# EasyEDA Pro project board.epro, board 黄山派核心板_PCB_V1.2
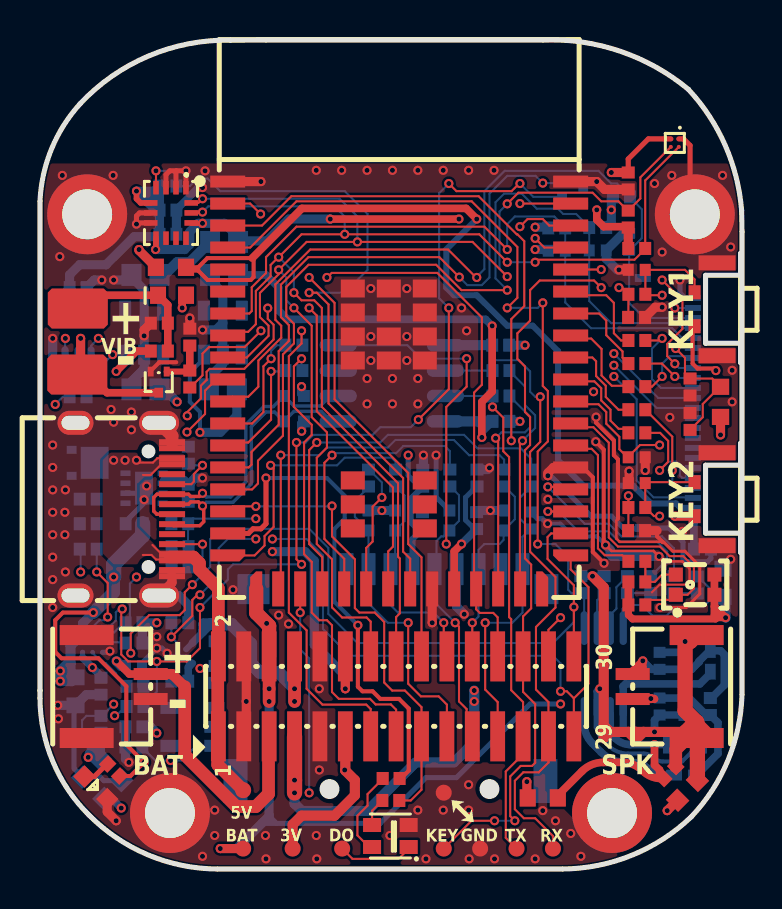
[diagram p11: board, top side]
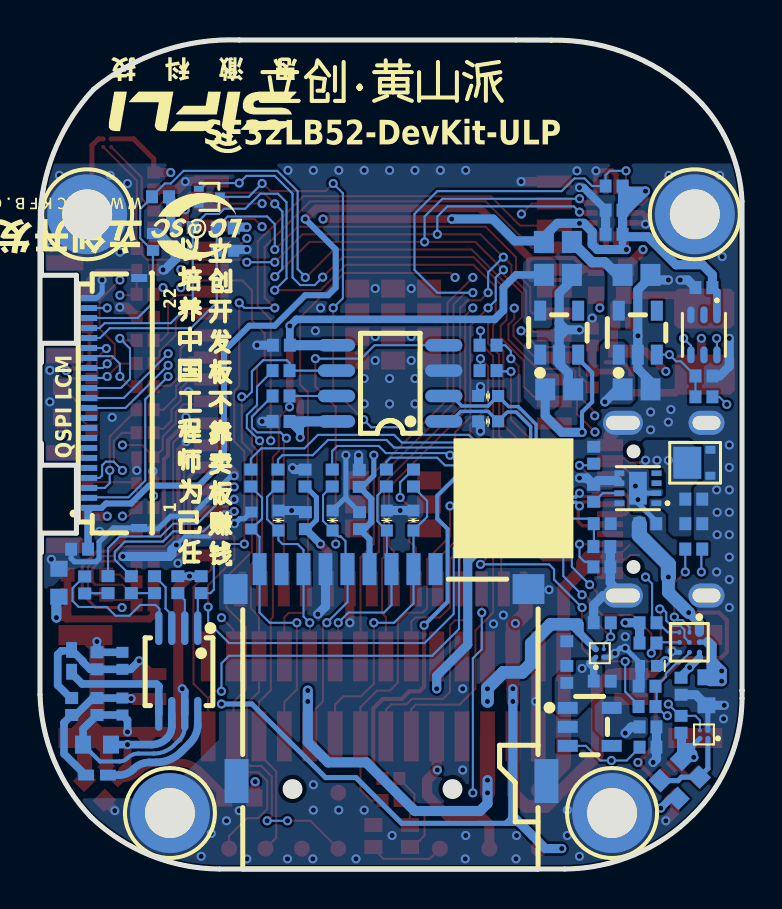
[diagram p12: board, bottom side, seen from below]

Outline 35.11 x 41.47 mm; copper layers: Top Layer, GND2, SIG3, Bottom Layer. Coordinates in mm from the lower left corner of the outline.
Outline path: 0,33.4 0,8.93 arc(0,8.93) 0,8.93 0,8.54 arc(0.64,5.38) 2.45,2.7 arc(5.39,0.71) 8.87,0 26.13,0 arc(29.6,0.69) 32.57,2.61 arc(34.41,5.44) 35.11,8.73 35.11,31.88 35.09,32.94 arc(34.27,36.2) 32.43,39 arc(29.02,40.91) 25.15,41.47 11.3,41.47 9.53,41.46 arc(5.43,40.67) 2.01,38.28 arc(0.58,36.02) 0,33.4
Stack: Top Layer 0.035mm 外层铜厚1oz / Dielectric1 0.2104mm 7628 RC49% 8.6mil / GND2 0.0152mm / Dielectric2 0.6mm 0.6mm H/HOZ 不含铜 / SIG3 0.0152mm / Dielectric3 0.2104mm 7628 RC49% 8.6mil / Bottom Layer 0.035mm 外层铜厚1oz

## Design rules (mm)
net CH_USB_DP: DP1
net CH_USB_DM: DP1
template: 自定义配置
spacing copperThickness1oz (default): track to track 0.102, other pairs 0.102 to 0.203
spacing copperThickness2oz: track to track 0.089, other pairs 0.089 to 0.3
spacing safeClearance1: track to track 0.152, other pairs 0 to 0.3
track width VCC AND GND1: min 0.104, default 0.457, max 2.54
track width TB单端50OHM (default): min 0.102, default 0.104, max 2.54
track width SIG单端50OHM: min 0.142, default 0.142, max 2.54
track width SIG共面单端50OHM: min 0.112, default 0.112, max 2.54
differential pair TB100OHM: width min 0.089, default 0.089, max 0.102; gap min 0.203, default 0.203
differential pair TB90OHM (default): width min 0.17, default 0.17, max 0.17; gap min 0.102, default 0.102
differential pair SIG100OHM: width min 0.089, default 0.102, max 0.102; gap min 0.203, default 0.203
differential pair SIG90OHM: width min 0.104, default 0.137, max 0.137; gap min 0.203, default 0.203
differential pair SIG共面100OHM: width min 0.091, default 0.091, max 0.091; gap min 0.203, default 0.203
differential pair SIG共面90OHM: width min 0.122, default 0.122, max 0.122; gap min 0.203, default 0.203
via viaSize (default): diameter min 0.457, default 0.457, max 0.457; hole min 0.254, default 0.254, max 0.254
net class GND AND VCC uses VCC AND GND1
net GND uses VCC AND GND1
net VCC_3V3 uses VCC AND GND1
net VSYS uses VCC AND GND1
net VBAT uses VCC AND GND1
net VSYS_1 uses VCC AND GND1
net VBUS_5V uses VCC AND GND1
net GS_3V3 uses VCC AND GND1
region e4130 uses safeClearance1
region e4131 uses safeClearance1

## Placement (name value [footprint] x y rotation side)
C1  4.7uF  [0402]  21.84 17.43 270 bottom
C2  1uF  [0402]  2.41 18.5 0 bottom
C3  4.7uF  [0402]  4.71 17.27 0 bottom
C4  1uF  [0402]  8.76 11.82 90 bottom
C5  1uF  [0402]  8.76 9.74 270 bottom
C6  10uF  [C0603]  1.78 8.89 90 bottom
C7  1uF  [0402]  4.75 9.14 180 bottom
C8  4.7uF  [0402]  3.05 9.14 90 bottom
C9  1uF  [0402]  6.99 9.4 0 bottom
C10  1uF  [0402]  4.7 7.11 0 bottom
C11  100nF  [0402]  23.05 22.39 0 bottom
C12  1uF  [0402]  23.04 26.2 180 bottom
C13  1uF  [0402]  33.13 16 0 bottom
C14  100nF  [0402]  32.51 24.11 90 top
C15  4.7uF  [0402]  32.51 22.39 270 top
C16  1uF  [0402]  19.13 17.43 270 bottom
C17  100nF  [0402]  19.14 19.54 270 bottom
C18  22uF  [C0603]  32.26 6.22 0 bottom
C19  100nF  [0402]  31.5 4.83 225 top
C20  100nF  [0402]  31.71 14.22 90 bottom
C21  100nF  [0402]  30.54 14.22 90 bottom
C22  330pF  [0402]  32.26 10.41 270 bottom
C23  330pF  [0402]  33.53 8.13 90 bottom
C24  1uF  [0402]  28.22 14.22 270 bottom
C25  330pF  [0402]  32.26 8.13 270 bottom
C26  4.7uF  [0402]  29.85 14.36 0 top
C27  10nF  [0402]  29.85 13.21 0 top
C28  4.7uF  [0402]  5.97 27.31 0 top
C29  100nF  [0402]  6.4 32.96 180 bottom
C30  100nF  [0402]  6.4 31.75 180 bottom
C31  100nF  [0402]  29.42 34.42 90 top
C33  1uF  [0603]  5.28 23.99 0 bottom
C34  1uF  [0603]  5.28 29.72 0 bottom
C35  100nF  [0402]  1.91 29.08 180 bottom
C36  1uF  [0603]  9.14 23.99 0 bottom
C37  1uF  [0603]  9.21 29.72 0 bottom
C38  1uF  [0402]  21.85 19.56 270 bottom
CARD1  TF-115Y-ACP9  [SIM-SMD_TF-115Y-BCP9]  17.56 9.7 180 bottom
CN1  A1257WR-S-2P  [CONN-SMD_A1257WR-S-2P]  3.94 9.13 270 top
CN2  A1257WR-S-2P  [CONN-SMD_A1257WR-S-2P]  31.24 9.13 90 top
CN3  XDZ127-2-15-S-1.0-G1  [HDR-SMD_30P-P1.27-V-M-R2-C15-LS5.5_1]  17.81 8.64 0 top
D1  ESD5451N  [DFN1006-2L-BI]  30.99 10.41 270 bottom
D2  ESD5451N  [DFN1006-2L-BI]  30.99 8.13 90 bottom
D3  KLXES15AAA1  [D0402-BI]  12.7 22.39 180 bottom
D4  KLXES15AAA1  [D0402-BI]  12.7 23.66 180 bottom
D5  ESD5451N  [DFN1006-2L-BI]  29.85 20.6 180 top
D6  ESD5451N  [DFN1006-2L-BI]  29.46 31.37 270 bottom
D7  ESD5451N  [DFN1006-2L-BI]  27.9 30.94 180 bottom
D8  ESD5451N  [DFN1006-2L-BI]  25.84 30.92 0 bottom
D9  ESD5451N  [DFN1006-2L-BI]  24.55 17.43 270 bottom
D10  KLXES15AAA1  [D0402-BI]  23.19 17.43 270 bottom
D11  KLXES15AAA1  [D0402-BI]  20.48 17.43 270 bottom
D12  KLXES15AAA1  [D0402-BI]  17.77 17.43 270 bottom
D13  KLXES15AAA1  [D0402-BI]  16.43 17.43 270 bottom
D14  ESD5451N  [DFN1006-2L-BI]  29.85 19.31 0 top
D15  ESD5451N  [DFN1006-2L-BI]  29.85 29.97 0 top
D16  CD4148WTP  [D0603-RD]  6.6 28.7 0 top
D17  PTVSHC3N18VU  [DFN-3_L2.0-W2.0-P1.30-BR]  2.16 20.32 180 bottom
D18  PESDHC2FD12VU  [DFN1006-2L-RD]  4.7 10.16 0 bottom
FPC1  AFH34-S22FIA-1H  [FPC-SMD_22P-P0.50_JS_AFH34-S22FIA-1H]  31.4 23.31 90 bottom
L1  PZ1005U121-1R0TF  [L0402]  33.53 10.41 90 bottom
L2  PZ1005U121-1R0TF  [L0402]  32.26 4.7 0 bottom
L3  CBG160808U000T  [L0603]  32.39 3.94 45 top
L4  CBG160808U000T  [L0603]  34.16 14.32 270 bottom
LED1  19-217/GHC-YR1S2/3T  [LED0603-RD]  2.79 4.06 135 top
LED3  WS2812B-2020  [LED-SMD_4P-L2.0-W2.0-TL_WS2812B-2020]  17.52 1.65 180 top
M1  M2-TH  [M2_TH_4_2.5MM]  6.5 2.8 0 top
M2  M2-TH  [M2_TH_4_2.5MM]  28.61 2.8 0 top
M3  M2-TH  [M2_TH_4_2.5MM]  32.75 32.75 0 top
M4  M2-TH  [M2_TH_4_2.5MM]  2.36 32.75 0 top
MT1  -  [TP-3x2MM]  1.89 28.04 0 top
MT2  -  [TP-3x2MM]  1.87 24.73 0 top
Q1  CJ3134K KF  [SOT-723_L1.2-W0.8-P0.40-LS1.2-BR]  26.64 33.62 0 bottom
Q2  CJ3134K KF  [SOT-723_L1.2-W0.8-P0.40-LS1.2-BR]  5.94 24.35 90 top
R1  0Ω  [R0603]  2.67 4.06 135 bottom
R2  510kΩ  [0402]  2.41 17.27 0 bottom
R3  5.1MΩ  [0402]  6.99 12.32 180 bottom
R4  20kΩ  [0402]  7.42 18.8 270 bottom
R5  100kΩ  [0402]  4.75 8.13 180 bottom
R6  4.7kΩ  [0402]  3.68 4.95 315 top
R7  5.1MΩ  [0402]  4.7 6.1 0 bottom
R8  0402WGF5101TCE  [0402]  7.42 20.7 90 bottom
R11  0402WGF1000TCE  [0402]  23.05 23.66 0 bottom
R12  0402WGF1000TCE  [0402]  23.05 24.93 0 bottom
R13  0402WGF5101TCE  [0402]  7.01 15.11 0 bottom
R14  390kΩ  [0402]  6.99 17.27 180 bottom
R15  510kΩ  [0402]  7.01 16.13 0 bottom
R16  22Ω  [0402]  29.85 22.97 0 top
R17  22Ω  [0402]  29.85 21.82 0 top
R18  22Ω  [0402]  29.85 26.44 0 top
R19  22Ω  [0402]  29.85 25.28 0 top
R20  22Ω  [0402]  29.85 24.13 0 top
R21  22Ω  [0402]  16.43 19.56 270 bottom
R22  22Ω  [0402]  17.79 19.56 270 bottom
R23  22Ω  [0402]  20.5 19.56 270 bottom
R24  22Ω  [0402]  23.21 19.56 270 bottom
R25  22Ω  [0402]  24.57 19.56 270 bottom
R26  0Ω  [R0603]  25.15 3.56 0 top
R27  43.2kΩ  [0402]  32.87 14.21 90 bottom
R28  43.2kΩ  [0402]  29.38 14.22 90 bottom
R29  5.1MΩ  [0402]  27.05 14.22 270 bottom
R30  1kΩ  [0402]  29.85 15.39 0 top
R31  0402WGF5101TCE  [0402]  29.85 18.08 0 top
R32  15kΩ  [0402]  29.84 16.93 180 top
R33  0Ω  [0402]  17.55 3.43 180 top
R34  0402WGF5101TCE  [0402]  29.85 28.75 0 top
R35  15kΩ  [0402]  29.84 27.59 180 top
R36  5.1Ω  [0402]  5.97 25.91 0 top
R37  1kΩ  [0402]  7.49 24.51 90 top
R38  1.5MΩ  [0402]  7.49 26.61 270 top
R41  5.1MΩ  [0402]  1.91 24.66 0 bottom
R42  2.2kΩ  [0402]  4.7 11.3 0 bottom
R43  2.2kΩ  [0402]  4.7 12.32 0 bottom
R44  2.2kΩ  [0402]  29.42 32.51 270 top
R45  2.2kΩ  [0402]  29.85 31.04 180 top
R46  2.2kΩ  [0402]  25.84 32.07 180 bottom
R47  2.2kΩ  [0402]  27.9 32.09 0 bottom
R48  2.2kΩ  [0402]  29.08 33.62 180 bottom
R49  0Ω  [R0603]  6.55 30.1 180 top
R50  0Ω  [R0603]  34.04 23.37 270 top
R51  0Ω  [0402]  17.56 4.53 0 top
R52  0Ω  [0603]  9.21 31.37 0 bottom
R54  22Ω  [0402]  1.91 23.62 0 bottom
R55  22Ω  [0402]  12.7 26.2 180 bottom
R56  22Ω  [0402]  12.7 24.93 180 bottom
R57  2.2kΩ  [0402]  6.4 34.16 180 bottom
R58  100kΩ  [0402]  3.05 7.24 270 bottom
R59  0Ω  [R0603]  3.56 4.95 135 bottom
R60  100kΩ  [0402]  2.41 16 0 bottom
SW1  GT-TC191A-H026-L60  [KEY-SMD_GT-TC191A-H026-L60]  33.3 28 90 top
SW2  GT-TC191A-H026-L60  [KEY-SMD_GT-TC191A-H026-L60]  33.3 18.5 90 top
TP1  -  [TP_C080]  10.16 1.02 0 top
TP2  -  [TP_C080]  10.16 3.94 0 top
TP3  -  [TP_C080]  12.64 1.02 0 top
TP4  -  [TP_C080]  23.83 1.02 0 top
TP5  -  [TP_C080]  25.65 1.02 0 top
TP6  -  [TP_C080]  22.01 1.02 0 top
TP7  -  [TP_C080]  20.19 3.82 0 top
TP8  -  [TP_C080]  20.19 1.02 0 top
TP9  -  [TP_C080]  15.11 1.02 0 top
U1  SF32LB52-MOD-1-N16R8  [COMM-SMD_L27.9-W18.0-P1.10_SF32LB52-MOD-1-N16R8]  17.97 24.2 0 top
U2  LP5240HVF  [WLCSP-4_L0.8-W0.8-R2-C2-P0.40-BL]  7.11 10.79 180 bottom
U3  AW32001ECSR  [WLCSP-9_L1.7-W1.7-R3-C3-P0.50-TL]  2.63 11.34 270 bottom
U4  ETA5055V330DS2F  [SOT-23-5_L2.9-W1.6-P0.95-LS2.8-BR]  7.62 7.11 0 bottom
U5  CH340N  [SOP-8_L4.9-W3.9-P1.27-LS6.0-BL]  17.6 24.3 90 bottom
U6  NS4150B  [MSOP-8_L3.0-W3.0-P0.65-LS5.0-BL]  28.19 9.91 0 bottom
U9  LMA2718T421-OA5  [MIC-SMD_4P-L2.8-W1.9-P1.01-TL]  32.77 14.22 90 top
U13  LSM6DS3TR-C  [LGA-14_L3.0-W2.5-P0.50-TL]  6.55 32.82 270 top
U14  MMC5603NJ  [FLIPCHIP-4_L0.8-W0.8-R2-C2-P0.40-TL]  31.75 36.32 270 top
U15  ETA5055V330DS2F  [SOT-23-5_L2.9-W1.6-P0.95-LS2.8-BR]  5.21 26.83 270 bottom
U16  LTR-303ALS-01  [TDFN-6_L2.0-W2.0-P0.65-BL]  1.91 26.72 0 bottom
U17  LP5305AQVF  [DFN-8_L2.0-W2.0-P0.50-BL-EP]  5.21 19.05 90 bottom
U18  ETA5055V330DS2F  [SOT-23-5_L2.9-W1.6-P0.95-LS2.8-BR]  9.14 26.83 270 bottom
U19  LP5240HVF  [WLCSP-4_L0.8-W0.8-R2-C2-P0.40-BL]  1.91 6.73 90 bottom
U20  -  [JLC-QRCODE-6x6]  11.43 18.54 180 bottom
USB1  KH-TYPE-C-16P  [USB-C-SMD_KH-TYPE-C-16P]  4.19 18 270 top

## Footprints (pads in the part's own frame, mm; a bottom-side part is the same pattern mirrored in y, then rotated)
0402
  rect 0.6x0.65 smd: 1(-0.424,0) 2(0.424,0)
0603
  rect 1x1.1 smd: 1(-0.7,0) 2(0.7,0)
C0603
  rect 0.8x0.9 smd: 1(-0.7,0) 2(0.7,0)
COMM-SMD_L27.9-W18.0-P1.10_SF32LB52-MOD-1-N16R8
  rect 1.75x0.6 smd: 1(-8.575,10.188) 2(-8.575,9.088) 3(-8.575,7.987) 4(-8.575,6.888) 5(-8.575,5.787) 6(-8.575,4.688) 7(-8.575,3.587) 8(-8.575,2.487) 9(-8.575,1.387) 10(-8.575,0.287) 11(-8.575,-0.812) 12(-8.575,-1.913) 13(-8.575,-3.013) 14(-8.575,-4.112) 15(-8.575,-5.213) 16(-8.575,-6.312) 17(-8.575,-7.412) 32(8.575,-7.412) 33(8.575,-6.312) 34(8.575,-5.213) 35(8.575,-4.112) 36(8.575,-3.013) 37(8.575,-1.913) 38(8.575,-0.812) 39(8.575,0.287) 40(8.575,1.387) 41(8.575,2.487) 42(8.575,3.587) 43(8.575,4.688) 44(8.575,5.787) 45(8.575,6.888) 46(8.575,7.987) 47(8.575,9.088) 48(8.575,10.188)
  custom 1.75x0.6 smd: 18(-8.575,-8.512) 31(8.575,-8.512)
  rect 0.6x1.75 smd: 19(-6.05,-10.188) 20(-4.95,-10.188) 21(-3.85,-10.188) 22(-2.75,-10.188) 23(-1.65,-10.188) 24(-0.55,-10.188) 25(0.55,-10.188) 26(1.65,-10.188) 27(2.75,-10.188) 28(3.85,-10.188) 29(4.95,-10.188) 30(6.05,-10.188)
  rect 1.2x0.9 smd: 49(-2.32,4.838) 50(-0.52,4.838) 51(1.28,4.838) 52(-2.32,3.638) 53(-0.52,3.638) 54(1.28,3.638) 55(-2.32,2.438) 56(-0.52,2.438) 57(1.28,2.438) 58(-2.32,1.238) 59(-0.52,1.238) 60(1.28,1.238) 63(-2.32,-4.763) 64(-2.32,-5.963) 65(-2.32,-7.162) 66(1.28,-4.763) 67(1.28,-5.963) 68(1.28,-7.162)
  custom 0.6x1.75 smd: 61(-7.15,-10.188) 62(7.15,-10.188)
CONN-SMD_A1257WR-S-2P
  rect 0.6x1.7 smd: 1(0.625,1.6) 2(-0.625,1.6)
  rect 1x2.7 smd: 3(2.575,-1.6) 4(-2.575,-1.6)
D0402-BI
  rect 0.6x0.6 smd: 1(-0.5,0) 2(0.5,0)
D0603-RD
  rect 0.8x0.864 smd: 1(-0.7,0) 2(0.7,0)
DFN1006-2L-BI
  rect 0.55x0.6 smd: 1(-0.425,0) 2(0.425,0)
DFN1006-2L-RD
  rect 0.5x0.6 smd: 1(-0.4,0) 2(0.4,0)
DFN-3_L2.0-W2.0-P1.30-BR
  rect 0.5x0.4 smd: 1(0.575,-0.65) 2(0.575,0.65)
  rect 1.4x1.6 smd: 3(-0.575,0)
DFN-8_L2.0-W2.0-P0.50-BL-EP
  rect 0.28x0.505 smd: 1(-0.75,-0.927) 2(-0.25,-0.927) 3(0.25,-0.927) 4(0.75,-0.927) 5(0.75,0.927) 6(0.25,0.927) 7(-0.25,0.927) 8(-0.75,0.927)
  rect 1.65x0.9 smd: 9(0,0)
FLIPCHIP-4_L0.8-W0.8-R2-C2-P0.40-TL
  round 0.2 smd: A1(-0.2,0.2) A2(0.2,0.2) B1(-0.2,-0.2) B2(0.2,-0.2)
FPC-SMD_22P-P0.50_JS_AFH34-S22FIA-1H
  rect 0.3x0.8 smd: 1(-5.25,1.25) 2(-4.75,1.25) 3(-4.25,1.25) 4(-3.75,1.25) 5(-3.25,1.25) 6(-2.75,1.25) 7(-2.25,1.25) 8(-1.75,1.25) 9(-1.25,1.25) 10(-0.75,1.25) 11(-0.25,1.25) 12(0.25,1.25) 13(0.75,1.25) 14(1.25,1.25) 15(1.75,1.25) 16(2.25,1.25) 17(2.75,1.25) 18(3.25,1.25) 19(3.75,1.25) 20(4.25,1.25) 21(4.75,1.25) 22(5.25,1.25)
  rect 0.4x0.8 smd: 23(6.25,-1.25) 24(-6.25,-1.25)
HDR-SMD_30P-P1.27-V-M-R2-C15-LS5.5_1
  rect 0.74x2.5 smd: 1(-8.89,-2) 2(-8.89,2) 3(-7.62,-2) 4(-7.62,2) 5(-6.35,-2) 6(-6.35,2) 7(-5.08,-2) 8(-5.08,2) 9(-3.81,-2) 10(-3.81,2) 11(-2.54,-2) 12(-2.54,2) 13(-1.27,-2) 14(-1.27,2) 15(0,-2) 16(0,2) 17(1.27,-2) 18(1.27,2) 19(2.54,-2) 20(2.54,2) 21(3.81,-2) 22(3.81,2) 23(5.08,-2) 24(5.08,2) 25(6.35,-2) 26(6.35,2) 27(7.62,-2) 28(7.62,2) 29(8.89,-2) 30(8.89,2)
KEY-SMD_GT-TC191A-H026-L60
  rect 0.7x0.6 smd: 1(-0.85,0.562) 2(0.85,0.562)
  rect 0.75x1.85 smd: 3(-2.325,-0.562) 4(2.325,-0.562)
L0402
  rect 0.79x0.54 smd: 1(-0.545,0) 2(0.545,0)
L0603
  rect 0.8x0.864 smd: 1(-0.7,0) 2(0.7,0)
LED0603-RD
  rect 0.8x0.8 smd: 1(-0.799,-0.004) 2(0.799,0.004)
LED-SMD_4P-L2.0-W2.0-TL_WS2812B-2020
  rect 0.9x0.7 smd: 1(-0.915,0.55) 2(-0.915,-0.55) 3(0.915,-0.55) 4(0.915,0.55)
LGA-14_L3.0-W2.5-P0.50-TL
  rect 0.675x0.28 smd: 1(-1.262,0.75) 2(-1.262,0.25) 3(-1.262,-0.25) 4(-1.262,-0.75) 8(1.262,-0.75) 9(1.262,-0.25) 10(1.262,0.25) 11(1.262,0.75)
  rect 0.28x0.675 smd: 5(-0.5,-1.012) 6(0,-1.012) 7(0.5,-1.012) 12(0.5,1.012) 13(0,1.012) 14(-0.5,1.012)
M2_TH_4_2.5MM
  round 4 hole 2.5: 1(0,0)
MIC-SMD_4P-L2.8-W1.9-P1.01-TL
  rect 0.7x0.7 smd: 1(-0.505,0.965) 2(-0.505,-0.965) 3(0.505,-0.965) 4(0.505,0.965)
MSOP-8_L3.0-W3.0-P0.65-LS5.0-BL
  oval 0.364x1.692 smd: 1(-0.975,-2.146) 2(-0.325,-2.146) 3(0.325,-2.146) 4(0.975,-2.146) 5(0.975,2.146) 6(0.325,2.146) 7(-0.325,2.146) 8(-0.975,2.146)
R0603
  rect 0.806x0.864 smd: 1(-0.753,0) 2(0.753,0)
SIM-SMD_TF-115Y-BCP9
  rect 0.7x1.6 smd: 1(2.225,5.3) 2(1.125,5.3) 3(0.025,5.3) 4(-1.075,5.3) 5(-2.175,5.3) 6(-3.275,5.3) 7(-4.375,5.3) 8(-5.475,5.3) 9(-6.575,5.3)
  rect 1.2x1.5 smd: 10(-7.775,4.3)
  rect 1.6x1.5 smd: 11(6.875,4.3)
  rect 1.2x2.2 smd: 12(-7.725,-5.3) 13(7.775,-5.3)
SOP-8_L4.9-W3.9-P1.27-LS6.0-BL
  oval 0.63x1.865 smd: 1(-1.905,-2.683) 2(-0.635,-2.683) 3(0.635,-2.683) 4(1.905,-2.683) 5(1.905,2.683) 6(0.635,2.683) 7(-0.635,2.683) 8(-1.905,2.683)
SOT-23-5_L2.9-W1.6-P0.95-LS2.8-BR
  rect 1x0.6 smd: 1(1.1,-0.95) 2(1.1,0) 3(1.1,0.95) 4(-1.1,0.95) 5(-1.1,-0.95)
SOT-723_L1.2-W0.8-P0.40-LS1.2-BR
  rect 0.489x0.294 smd: 1(0.529,-0.4) 2(0.529,0.4)
  rect 0.489x0.434 smd: 3(-0.529,0)
TDFN-6_L2.0-W2.0-P0.65-BL
  oval 0.364x0.847 smd: 1(-0.65,-0.999) 2(0,-0.999) 3(0.65,-0.999) 4(0.65,0.999) 5(0,0.999) 6(-0.65,0.999)
TP-3x2MM
  custom 3x2 smd: 1(0,0)
TP_C080
  round 0.8 smd: 1(0,0)
USB-C-SMD_KH-TYPE-C-16P
  oval 1.2x2 hole 0.7x1.7: 1(-4.32,1.765) 2(4.32,1.765)
  oval 1.2x1.8 hole 0.7x1.4: 3(-4.32,-2.415) 4(4.32,-2.415)
  rect 0.3x1.3 smd: A1(-3.35,2.415) A4(-2.55,2.415) A5(-1.25,2.415) A6(-0.25,2.415) A7(0.25,2.415) A8(1.25,2.415) A9(2.55,2.415) A12(3.35,2.415) B1(3.05,2.415) B4(2.25,2.415) B5(1.75,2.415) B6(0.75,2.415) B7(-0.75,2.415) B8(-1.75,2.415) B9(-2.25,2.415) B12(-3.05,2.415)
WLCSP-4_L0.8-W0.8-R2-C2-P0.40-BL
  round 0.2 smd: A1(-0.2,-0.2) A2(-0.2,0.2) B1(0.2,-0.2) B2(0.2,0.2)
WLCSP-9_L1.7-W1.7-R3-C3-P0.50-TL
  round 0.24 smd: A1(-0.5,0.5) A2(0,0.5) A3(0.5,0.5) B2(0,0) B3(0.5,0) C2(0,-0.5) C3(0.5,-0.5)
  oval 0.24x0.19 smd: B1(-0.5,0.001) C1(-0.5,-0.5)

## Nets
As in the schematic.

Pads without a net: CARD1 1 8; FPC1 5 6 7 8 9 10; U1 5 6 62 63 64 65 66 67 68; U4 4; U13 9 10 11; U15 4; U16 2 5; U17 3 4; U18 4; USB1 A8 B8

## Via types
v1: diameter 0.457, hole 0.254, Top Layer to Bottom Layer, 306 vias

## Routing (per net, layer and track width the routed paths; a pad name or vN(x,y) marks a point on that pad's centre or on a via; arc(x,y) is an arc through that point)
GND: length 144.4
  Top Layer w0.104: 30.61,13.84 30.99,14.22 32.34,14.22 32.39,14.27
  Top Layer w0.127: 28.91,17.51 28.83,17.43 28.83,16.53 28.99,16.36 31.14,16.36 ; v1(28.29,16.21) 28.58,15.91 30.69,15.91 v1(30.96,15.64) 31.21,15.39 32.13,15.39 32.49,15.03 32.49,14.37 32.39,14.27
  Top Layer w0.152: 31.16,16.35 31.21,16.35 31.66,15.9 32.25,15.9 33,15.15 33,13.76 32.32,13.08 v1(31.01,13.08)
  Top Layer w0.203: v1(27.81,22.61) 27.81,22.32 28.7,21.43 28.7,20.7 28.91,20.5 28.91,17.51 ; v1(27.8,21.38) 28.19,20.98 28.19,16.3 v1(28.29,16.21) ; 6.82,25.35 5.97,25.35 5.54,24.92 Q2.2 ; 30.86,16.93 30.86,16.64 31.14,16.36 31.16,16.35 ; v1(28.21,15.3) 27.65,15.86 27.65,19.6 27.16,20.09 U1.35
  Top Layer w0.254: U13.6 4.98,32.82 4.83,32.67 v1(4.83,32.26) 4.89,32.32 U13.7 ; U13.3 6.3,34.73 6.49,34.93 6.82,34.93 ; M3.1 32.51,32.99 32.51,36.2 32.19,36.52 U14.A1 ; U13.2 6.8,34.91 6.82,34.93 ; 6.82,34.93 v1(7.3,34.93) U13.1
  Top Layer w0.457: LED1.1 3.36,2.86 v1(3.81,2.41) ; v1(31.12,28.1) 30.77,28.1 R35.1 ; R32.1 30.86,16.93 ; D14.1 29.46,19.35 v1(29.46,19.9) ; C31.1 28.24,33.99 v1(27.84,34.39) U1.48 ; U1.35 25.68,20.09 25.4,19.81 v1(25.4,19.67) ; CN3.3 10.32,6.76 v1(10.32,8.38) 10.32,10.51 CN3.4 ; 31.89,3.44 v1(31.37,2.92) ; D15.1 v1(28.96,29.97) ; USB1.2 6.61,14.33 USB1.A12 ; v1(5.21,26.67) 5.21,26.97 C28.1 ; 30.27,20.6 v1(30.27,19.94) ; R38.1 v1(7.49,27.56) ; 9.39,34.39 v1(11.05,34.39) ; U1.26 v1(19.62,12.32)
  Top Layer w0.635: USB1.A1 6.61,21.67 5.96,22.32
  Bottom Layer w0.203: v1(28.29,16.21) 27.86,16.64 26.67,16.64 26.03,17.28 v1(25.39,17.28)
  Bottom Layer w0.254: 19.81,18.6 v1(19.81,20.7) ; 19.81,18.6 D11.1 ; 19.81,18.6 19.81,18.53 C16.1 ; U17.2 4.96,18.8 U17.9 v1(5.21,18.48) 5.21,18.31 4.29,17.39 C3.1 ; 5.1,10.31 v1(5.84,11.05) 6.1,11.05 v1(6.36,10.79) 6.55,10.59 U2.B1 ; D9.1 24.88,17.53 25.12,17.53 25.36,17.28 v1(25.39,17.28) ; v1(3.5,10.9) 3.44,10.84 U3.C3 ; C6.1 1.71,8.12 U19.B1 ; v1(25.4,19.67) 25.54,19.67 27.56,17.65 28.58,17.65 29.21,17.02 30.1,17.02 FPC1.24 31.45,17.06 32.16,16.36 32.16,15.52 32.31,15.37 33.38,15.37 33.55,15.54 C13.2 ; v1(32,29.46) 32,28.83 32.27,28.56 FPC1.22
  Bottom Layer w0.381: v1(8.13,34.09) 7.93,34.09 6.82,32.99
  Bottom Layer w0.457: CARD1.6 20.83,13.13 v1(21.22,12.75) ; 6.22,19.43 7.21,19.43 R4.1 7.75,19.56 v1(8.13,19.56) ; C11.2 v1(24,22.39) ; R3.1 7.42,13.21 6.95,13.68 USB1.2 6.58,14.31 R13.1 R15.1 ; v1(3.09,29.46) 2.71,29.46 C35.1 ; 9.14,26.63 9.14,26.97 ; 9.14,26.63 8.8,26.97 ; 9.14,26.63 U18.2 9.14,25.27 8.69,24.82 8.69,24.24 C36.1 ; 9.14,26.97 8.8,26.97 ; 9.14,26.97 9.14,27.31 ; 8.8,26.97 v1(8.13,26.97) ; 8.8,26.97 9.14,27.31 ; v1(13.09,21.9) 13.09,22.28 D3.1 ; v1(0.64,26.54) 0.64,25.15 1.12,24.66 R41.1 ; D8.1 25.36,30.99 v1(24.77,30.99) ; v1(3.68,29.46) 4.32,29.46 C34.1 4.58,29.6 5.21,28.96 5.21,25.02 4.58,24.39 C33.1 ; C10.1 R7.1 4.28,5.5 v1(4.45,5.33) ; C30.1 C29.1 ; D10.1 v1(22.52,17.93) 21.92,17.93 C1.1 ; v1(28.29,16.21) 28.51,15.98 28.51,15.75 28.63,15.64 v1(30.96,15.64) ; D6.1 29.17,31.79 D7.1 28.32,30.52 28.87,29.97 v1(28.96,29.97) ; 9.14,27.31 9.14,28.81 8.51,29.45 C37.1 ; C38.1 22.4,19.98 v1(22.48,20.07) ; C12.1 v1(24.26,26.2) ; v1(19.18,20.7) 19.18,20 C17.1 ; v1(0.89,8.19) C6.1 2.31,8.72 C8.1 ; D18.2 5.1,9.17 5.12,9.14 ; D12.1 D13.1 ; D4.1 13.08,23.78 v1(13.08,24.13)
  vias: v1(0.64,21.21) v1(0.64,20.09) v1(0.64,18.97) v1(0.64,17.84) v1(0.64,16.72) v1(0.64,15.6) v1(0.64,14.48) v1(0.64,13.08) v1(0.92,7.51) v1(0.99,30.63) v1(1.12,34.7) v1(1.27,18.97) v1(1.24,17.84) v1(1.24,16.72) v1(1.27,14.86) v1(3.56,22.99) v1(3.66,34.7) v1(3.68,22.35) v1(4.57,22.86) v1(4.57,21.97) v1(5.33,19.16) v1(5.84,11.62) v1(8.13,0.64) v1(8.26,34.93) v1(8.74,2.95) v1(8.74,1.68) v1(9.65,13.97) v1(11.28,1.68) v1(11.3,0.51) v1(11.94,12.7) v1(12.43,12.26) v1(13.82,34.95) v1(13.82,1.68) v1(13.84,0.51) v1(13.97,9.02) v1(13.97,4.95) v1(15.09,34.95) v1(16.36,34.95) v1(16.36,24.54) v1(16.36,23.27) v1(16.55,29.04) v1(16.55,26.64) v1(16.55,25.44) v1(17.1,17.93) v1(17.5,1.68) v1(17.63,34.95) v1(17.63,24.54) v1(17.63,23.27) v1(18.35,29.04) v1(18.35,26.64) v1(18.35,25.44) v1(18.9,34.95) v1(18.9,24.54) v1(18.9,23.27) v1(18.9,2.95) v1(19.3,0.51) v1(20.17,34.95) v1(20.17,2.95) v1(21.08,28.07) v1(21.34,26.92) v1(21.44,34.95) v1(21.44,4.22) v1(21.44,2.95) v1(21.46,0.51) v1(22.71,34.95) v1(22.73,0.51) v1(24.77,0.51) v1(25.15,2.92) v1(25.4,18.49) v1(25.78,2.41) v1(26.54,1.78) v1(27.05,0.64) v1(27.69,23.88) v1(30.73,34.29) v1(31.12,30.86) v1(31.5,22.59) v1(31.6,34.7) v1(32.13,16.89) v1(34.14,34.7) v1(34.54,31.12) v1(34.62,24.95) v1(34.62,23.37) v1(34.54,15.49)
VBAT: length 81.5
  Top Layer w0.203: v1(33.8,24.93) 33.7,25.04 32.89,25.04 32.64,25.28 32.64,27.05 SW1.1
  Top Layer w0.457: TP1.1 v1(9.02,1.02) ; SW2.1 v1(31.75,17.65)
  Top Layer w0.635: v1(11.46,8.38) v1(11.46,9.02) CN3.6
  Top Layer w0.711: CN3.6 11.46,12.16 v1(11.34,12.29) 10.82,12.81 U1.61
  SIG3 w0.254: v1(33.8,24.93) 33.8,22.95 34.54,22.21 34.54,21.34 34.16,20.96 33.15,20.96 32.51,20.32 32.51,18.41 v1(31.75,17.65) 31.24,18.16 29.16,18.16 26.87,20.45 24.64,20.45 23.88,19.69 23.88,16.19 25.27,14.79 25.27,8.89 25.91,8.26 v1(26.04,8.26)
  SIG3 w0.457: v1(2.62,10.08) 3.23,9.47 8.2,9.47 8.2,9.47 8.23,9.47 11.05,12.29 v1(11.34,12.29)
  Bottom Layer w0.254: U3.A3 2.13,10.57 ; 11.82,2.29 11.15,2.29 11.13,2.31 ; 11.82,2.29 11.46,2.65 ; 11.82,2.29 17.02,2.29 19.3,4.57 20.83,4.57 24.51,8.26 v1(26.04,8.26)
  Bottom Layer w0.381: C8.2 3.05,9.65 v1(2.62,10.08) 2.13,10.57
  Bottom Layer w0.457: v1(9.02,1.02) 9.83,1.02 11.46,2.65 v1(11.46,8.38) v1(11.46,9.02)
VBAT_S: length 16.3
  Top Layer w0.381: v1(3.83,10.4) 4.47,9.75 5.66,9.75
  Top Layer w0.508: 7.24,9.12 6.6,9.75 5.66,9.75
  Top Layer w0.635: 7.24,9.12 7.24,5.71 9.82,3.13 10.8,3.13 11.43,3.76 11.43,6.64
  Bottom Layer w0.508: v1(3.83,10.4) 4.06,10.16 D18.1
VBUS_5V: length 37.8
  Top Layer w0.203: v1(2.67,12.83) 1.14,12.83 0.76,12.45 0.76,10.86 1.08,10.54 2.92,10.54 4.32,9.14 4.32,6.22 v1(5.21,5.33) 4.53,4.65 R6.2
  SIG3 w0.457: v1(8,21.84) 8,21.08 6.6,19.69 6.6,17.53 5.84,16.76 4.83,16.76 3.68,15.62 v1(3.68,14.61)
  Bottom Layer w0.203: v1(8,21.84) 8,22.86 7.49,23.37 7.49,24.83 8.19,25.53 U18.3
  Bottom Layer w0.457: 9.84,23.99 9.84,22.67 9.02,21.84 v1(8,21.84) ; v1(2.67,12.83) 2.13,12.29 U3.A1
  Bottom Layer w0.635: v1(3.68,14.61) 3.68,13.84 v1(2.67,12.83)
  Bottom Layer w0.762: C3.2 5.13,16.69 3.68,15.24 v1(3.68,14.61)
VCC_3V3: length 100.9
  Top Layer w0.457: CN3.12 v1(15.27,9.02) ; R50.2 v1(34.04,21.72)
  SIG3 w0.457: v1(15.27,9.02) 16.79,7.49 21.84,7.49 24.64,10.29 24.64,14.66 21.08,18.22 21.08,21.18 ; 23.37,24 23.5,24 23.76,24.27 ; 23.37,24 22.23,24 21.08,22.86 21.08,22 ; 23.37,24 23.76,23.61 ; 23.76,24.27 23.76,23.62 23.76,23.61 ; 23.76,24.27 25.78,26.29 25.78,31.37 25.04,32.11 v1(24.77,32.11) ; v1(5.84,12.32) 9.02,12.32 11.62,14.93 v1(11.62,15.88) ; 20.67,21.59 18.92,21.59 18.42,21.08 v1(18.42,20.7) ; 20.67,21.59 21.08,21.18 ; 20.67,21.59 21.08,22 ; 20.67,21.59 21.08,21.59 21.08,21.58 ; 23.76,23.61 25.4,21.97 28.07,21.97 29.46,20.57 31.62,20.57 32.77,21.72 32.77,22.14 ; v1(34.04,21.72) 33.2,21.72 ; 33.2,21.72 32.77,22.14 ; 33.2,21.72 32.77,21.72 ; 32.77,22.14 32.77,29.59 32.13,30.23 29.97,30.23 28.57,31.62 v1(28.57,32.97) ; 21.08,21.58 21.08,22 ; 21.08,21.58 21.08,21.18
  Bottom Layer w0.254: v1(18.42,20.7) 18.42,19.69 18.98,19.12 C17.2
  Bottom Layer w0.305: CARD1.4 18.63,16.5 C16.2 18.89,17 18.54,17.35 18.54,18.52 C17.2
  Bottom Layer w0.457: v1(11.62,15.88) 13.26,15.88 13.72,15.42 13.72,11.22 15.27,9.66 v1(15.27,9.02) ; R48.2 28.57,33.54 v1(28.57,32.97) 28.57,32.34 R47.2 ; v1(5.84,12.32) R43.2 R42.2 ; R46.2 25.38,32.11 v1(24.77,32.11)
VCC_3V3_S: length 19.6
  Top Layer w0.508: TP3.1 12.64,2.22 13.08,2.67 14.73,2.67 15.75,3.68 15.75,4.45 15.27,4.92 CN3.11
  SIG3 w0.457: v1(15.24,4.95) 15.24,5.84 14.28,6.8 v1(5.84,6.8)
  Bottom Layer w0.457: v1(5.84,6.8) 5.53,7.11 C10.2
VDD33_VOUT: length 39.3
  Top Layer w0.203: v1(15.9,12.19) 15.9,9.12 16.13,8.89 16.64,8.89 17.02,8.51 17.96,8.51 18.44,8.02 18.44,4.92 18.05,4.53
  Top Layer w0.254: v1(11.3,19.56) 11.3,17.27 11.05,17.02 10.66,17.02 10.43,16.79 9.39,16.79
  Top Layer w0.381: v1(3.81,24.89) 4.83,25.91 R36.1
  SIG3 w0.381: v1(3.81,24.89) 4.57,24.13 9.78,24.13 10.74,23.17 10.74,20.12 v1(11.3,19.56)
  Bottom Layer w0.203: v1(11.3,19.56) 14.35,19.56 15.24,18.67 15.24,17.53 14.73,17.01 14.73,13.37 v1(15.9,12.19)
ADCIN: length 15.7
  Top Layer w0.104: 30.28,13.46 31.54,13.46 U9.1 32.39,13.72 32.7,14.04 32.7,15.12 32.17,15.65 31.49,15.65 31.01,16.13 28.91,16.13 28.45,16.59 28.45,21.33 27.68,22.1 26.73,22.1 U1.37
CH_3V3: length 27
  Top Layer w0.381: v1(22.1,21.59) 22.1,23.37 22.62,23.89 v1(22.62,27.17)
  Bottom Layer w0.381: 21.86,22.39 22.1,22.15 22.1,21.86 ; C12.2 v1(22.62,27.17) 22.29,27.5 12.38,27.5 11.94,27.94 11.94,29.08 11.3,29.72 C37.2 ; v1(22.1,21.59) 22.1,21.86 ; 22.1,21.86 C11.1
  Bottom Layer w0.508: 20.53,22.39 C11.1 ; 20.53,26.2 C12.2
CH_RTS#: length 40.4
  Top Layer w0.104: v1(20.32,16.26) 20.32,23.11 21.34,24.13 v1(21.34,25.53)
  SIG3 w0.104: v1(3.68,8.25) 3.83,8.39 8.9,8.39 10.92,10.41 17.27,10.41 19.05,12.19 19.05,14.99 v1(20.32,16.26)
  Bottom Layer w0.104: v1(3.68,8.25) 3.1,7.66 R58.1 2.33,7.66 2.11,7.44 U19.B2 ; U5.4 18.38,26.2 19.05,25.53 v1(21.34,25.53)
CH_USB_DM: length 15.6
  Top Layer w0.17: v1(8.13,18.8) 7.97,18.64 7.54,18.64 7.43,18.75 USB1.B7 5.85,18.75 5.69,18.58 5.69,17.9 5.84,17.75 USB1.A7
  Bottom Layer w0.17: 15.16,23.66 14.52,23.66 14.02,23.16 12.7,23.16 D4.2 11.67,23.13 11.19,23.13 10.3,22.24 10.3,19.37 9.54,18.61 8.31,18.61 v1(8.13,18.8)
CH_USB_DP: length 15.4
  Top Layer w0.17: USB1.B6 6.68,17.17 7.99,17.17 8.19,17.37 8.19,18.1 v1(8.13,18.16) 7.93,18.36 7.54,18.36 7.43,18.25 USB1.A6
  Bottom Layer w0.17: v1(8.13,18.16) 8.31,18.34 9.65,18.34 10.57,19.26 10.57,22.13 11.3,22.86 11.73,22.86 D3.2 12.7,22.89 14.07,22.89 14.57,22.39 15.16,22.39
CHG_INT: length 52
  Top Layer w0.104: v1(4.11,13.01) 4.06,12.96 4.06,10.73 4.41,10.38 v1(5.84,10.38) 7.34,10.38 8,11.05 v1(8,13.08) ; v1(12.83,21.34) 12.83,15.49 v1(13.08,15.24) ; v1(20.45,28.07) 20.45,24 v1(18.92,22.48) ; v1(20.45,34.29) 20.83,33.91 23.59,33.91 23.97,34.29 v1(24,34.29)
  Bottom Layer w0.104: v1(20.45,28.07) 19.96,28.55 19.96,33.8 v1(20.45,34.29) ; v1(12.83,21.34) 13.29,21.34 13.67,21.72 16.64,21.72 17.02,22.1 18.54,22.1 v1(18.92,22.48) ; Q1.3 24.67,33.62 v1(24,34.29) ; U3.B2 2.88,11.59 2.88,11.97 3.07,12.16 3.53,12.16 3.79,12.43 3.79,12.83 3.97,13.01 v1(4.11,13.01) ; v1(13.08,15.24) 9.65,15.24 9.4,14.99 9.4,14.48 v1(8,13.08) ; 5.12,8.13 5.12,8.15 5.84,8.87 v1(5.84,10.38)
DAC1N: length 10.2
  Top Layer w0.104: U1.34 26.41,19.11 v1(25.4,19.11)
  Bottom Layer w0.104: v1(25.4,19.11) 27.24,17.27 28.45,17.27 29.08,16.64 31.12,16.64 31.71,16.04 C20.2
DAC1P: length 9.5
  Top Layer w0.104: U1.33 v1(25.4,17.89)
  Bottom Layer w0.104: v1(25.4,17.89) 25.93,17.89 26.92,16.89 28.45,16.89 28.96,16.38 30.86,16.38 31.37,15.88 31.37,15.47 C21.2
GS_3V3: length 52.3
  Top Layer w0.254: 31.55,36.52 30.43,36.52 29.42,35.52 C31.2 ; 7.57,32.3 v1(8.13,32.3)
  Top Layer w0.28: v1(4.83,33.91) 4.83,33.53 5.04,33.32 U13.5 ; U13.8 5.8,31.01 v1(5.78,30.99)
  Top Layer w0.381: v1(27.85,32.97) 27.85,32.48 28.19,32.13 29.38,32.13 R44.2 ; v1(14.52,32.51) v1(20.96,32.51)
  Top Layer w0.457: R44.2 R45.2 ; C31.2 v1(28.58,34.84)
  SIG3 w0.457: 27.85,33.37 27.54,33.67 ; 27.85,33.37 28.16,33.67 ; 27.85,33.37 v1(27.85,32.97) ; 27.54,33.67 28.16,33.67 ; 27.54,33.67 26.29,34.93 23.75,34.93 22.86,34.04 22.48,34.04 v1(20.96,32.51) ; 28.16,33.67 28.58,34.09 v1(28.58,34.84)
  Bottom Layer w0.381: C35.2 1.26,28.86 U16.1 ; C30.2 5.98,31.05 5.91,30.99
  Bottom Layer w0.457: C29.2 5.98,33.54 ; C29.2 C30.2 5.86,31.63 4.71,31.63 3.3,30.23 1.98,30.23 1.48,29.72 C35.2 ; C29.2 5.78,32.96 5.19,33.54 ; 5.98,33.54 5.19,33.54 ; 5.98,33.54 R57.2 5.72,33.91 v1(4.83,33.91) 5.19,33.54 ; 9.91,31.42 9.91,31.62 9.23,32.3 v1(8.13,32.3) 7.92,32.3 7.49,31.88 7.49,31.24 7.24,30.99 v1(5.78,30.99) ; 9.91,31.42 11.35,31.42 12.45,32.51 v1(14.52,32.51) ; 9.91,31.42 R52.2
MIC_BIAS: length 8
  Top Layer w0.104: R30.1 29.13,15.69 28.25,15.69 27.9,16.04 27.9,20.7 27.59,21.02 26.71,21.02 U1.36
MIC_GND: length 10.6
  Top Layer w0.355: v1(34.29,12.57) 33.85,12.57 33.78,12.51 29.63,12.51 29.43,12.71 C27.1
  Top Layer w0.381: 33.73,13.13 v1(34.29,12.57) ; 33.73,13.13 U9.2 U9.3 ; 33.73,13.13 33.73,12.69 33.85,12.57 ; C26.1 C27.1
  Bottom Layer w0.508: 34.16,13.52 34.29,13.4 v1(34.29,12.57)
PA_00_LCD_QSPI_RSTB: length 18
  Top Layer w0.104: U1.47 v1(24,33.29)
  SIG3 w0.104: v1(28.7,25.78) 27.18,27.31 27.18,32.13 26.02,33.29 v1(24,33.29)
  Bottom Layer w0.104: v1(28.7,25.78) 30.92,23.56 FPC1.12
PA_01_LCD_BL_PWM: length 22.5
  Top Layer w0.104: U1.46 25.47,32.19 25.15,32.51 24.38,32.51 v1(24,32.13)
  SIG3 w0.104: v1(28.7,24.64) 26.29,27.05 26.29,31.75 25.53,32.51 24.38,32.51 v1(24,32.13)
  Bottom Layer w0.104: FPC1.2 32.62,18.59 30.68,18.59 29.85,19.43 29.85,23.5 v1(28.7,24.64)
PA_02_LCD_QSPI_TE: length 20
  Top Layer w0.104: v1(24.77,31.55) 25.22,31.09 U1.45
  SIG3 w0.104: v1(28.7,25.2) 26.8,27.1 26.8,31.88 25.78,32.89 24,32.89 23.62,32.51 23.62,31.75 23.83,31.55 v1(24.77,31.55)
  Bottom Layer w0.104: v1(28.7,25.2) 30.84,23.06 FPC1.11
PA_03_LCD_QSPI_CS: length 10.9
  Top Layer w0.104: U1.44 v1(28.07,29.99) ; v1(31.12,29.46) 32.13,28.45 32.13,27.02 31.37,26.26 31.37,25.65 v1(31.75,25.27)
  SIG3 w0.104: v1(31.12,29.46) 28.59,29.46 v1(28.07,29.99)
  Bottom Layer w0.104: v1(31.75,25.27) 31.96,25.06 FPC1.15
PA_04_LCD_QSPI_CLK: length 4.8
  Top Layer w0.104: R18.1 29.06,26.44 28.7,26.8 28.7,28.32 28.32,28.7 26.73,28.7 U1.43
PA_05_LCD_QSPI_D0: length 4.5
  Top Layer w0.104: U1.42 27.97,27.79 28.32,27.43 28.32,26.7 29.14,25.89 29.14,25.58 R19.1
PA_06_LCD_QSPI_D1: length 4.7
  Top Layer w0.104: R20.1 29.38,24.17 28.6,24.17 28.09,24.69 28.09,26.02 27.57,26.53 26.69,26.53 U1.41
PA_07_LCD_QSPI_D2: length 4.7
  Top Layer w0.104: R16.1 28.94,22.97 28.3,23.61 28.3,24.18 27.81,24.66 27.81,25.4 27.63,25.59 U1.40
PA_08_LCD_QSPI_D3: length 4.7
  Top Layer w0.104: R17.1 29.23,22.02 28.94,22.02 28.53,22.43 28.53,22.98 28.07,23.44 28.07,24.05 27.73,24.4 26.63,24.4 U1.39
PA_09_TP_RSTN: length 15.2
  Top Layer w0.104: v1(30.99,21.21) 30.01,21.21 29.42,20.62 D5.2 29.38,20.6 28.98,21 28.98,21.62 28.32,22.27 28.32,22.86 27.93,23.25 26.68,23.25 U1.38
  SIG3 w0.104: v1(31.75,28.06) 32.39,27.43 32.39,22.61 v1(30.99,21.21)
  Bottom Layer w0.104: FPC1.21 v1(31.75,28.06)
PA_10_I2C0_SCL: length 41.7
  Top Layer w0.104: CN3.30 v1(26.7,13.11) 26.7,14.19 25.39,15.51 25.39,16.61 25.57,16.79 U1.32 ; v1(7.62,14.22) 7.24,13.84 7.24,12.95 6.99,12.7 5.46,12.7 4.54,11.78 v1(4.54,10.8)
  Bottom Layer w0.104: v1(7.62,14.22) 8.51,15.11 8.51,16.51 9.02,17.02 13.46,17.02 14.42,16.06 14.42,12.76 15.88,11.3 25.65,11.3 26.7,12.35 v1(26.7,13.11) ; v1(4.54,10.8) 4.54,11.04 R42.1 4.24,11.34 U3.C2
PA_11_I2C0_SDA: length 44.3
  Top Layer w0.104: 26.7,8.54 26.35,8.89 v1(26.04,8.89) ; 26.7,8.54 CN3.29 ; 26.7,8.54 27.43,9.27 27.43,14.1 26.54,14.99 U1.31
  SIG3 w0.104: v1(11.62,16.51) 11.12,16 10.16,16 9.4,16.76 6.86,16.76 6.35,16.26 5.08,16.26 4.45,15.62 4.45,14.99 v1(4.83,14.61)
  Bottom Layer w0.104: v1(11.62,16.51) 13.34,16.51 14.15,15.69 14.15,12.01 15.49,10.67 25.65,10.67 26.04,10.29 v1(26.04,8.89) ; v1(4.83,14.61) 4.5,14.28 4.5,12.54 R43.1 4.19,12.32 3.71,11.84 U3.C1
PA_18_UART_RXD: length 11.8
  Top Layer w0.104: U1.30 24,14.02 24,21.3 v1(24.13,21.42)
  Bottom Layer w0.104: R12.2 23.48,24.91 24.26,24.13 24.26,23.21 24.77,22.7 24.77,22.06 v1(24.13,21.42)
PA_19_UART_TXD: length 11.5
  Top Layer w0.104: v1(22.79,21.55) 22.92,21.42 U1.29
  Bottom Layer w0.104: v1(22.79,21.55) 23.08,21.84 24.26,21.84 24.51,22.1 24.51,22.63 R11.2
PA_20_VIB_PWM: length 37.6
  Top Layer w0.104: v1(11.05,26.92) 10.23,26.11 8.46,26.11 8.13,25.78 8.13,24.7 7.52,24.09 R37.1 ; CN3.24 22.89,12.59 22.67,12.81 22,12.81 21.82,12.99 U1.28 21.71,14.12 21.71,23.83 22.1,24.22 22.1,27.59 19.87,29.82 14.59,29.82 14.36,29.59 v1(14.35,29.59)
  SIG3 w0.104: v1(11.05,26.92) 11.94,27.81 11.94,28.96 13.08,30.1 13.84,30.1 v1(14.35,29.59)
PA_24_SPI1_DO: length 13.2
  Top Layer w0.104: 9.39,15.69 10.73,15.69 11.23,16.18 11.23,16.66 11.68,17.11 11.68,20.04 11.53,20.19
  Bottom Layer w0.104: R22.1 17.79,20.37 17.58,20.57 15.24,20.57 14.86,20.19 v1(11.53,20.19)
PA_24_SPI1_DO_1: length 11.1
  Top Layer w0.104: v1(20.19,12.32) 20.19,10.99 20.42,10.77
  Bottom Layer w0.104: v1(20.19,12.32) 19.69,12.83 17.91,12.83 17.53,13.2 CARD1.3 17.77,15.24 D12.2 18.24,17.4 18.24,18.68 17.79,19.13
PA_25_SPI1_DI: length 19.1
  Top Layer w0.104: v1(12.04,20.7) 12.04,14.14 U1.19
  Bottom Layer w0.104: v1(12.04,20.7) 13.97,20.7 14.35,21.08 17.4,21.08 17.78,21.46 20.7,21.46 21.46,20.7 22.99,20.7 23.21,20.48 R24.1
PA_25_SPI1_DI_1: length 10.1
  Top Layer w0.104: CN3.22 v1(21.62,12.32)
  Bottom Layer w0.104: 23.21,19.13 23.24,19.13 23.75,18.62 23.75,17.5 D10.2 23.19,16.46 22.98,16.26 22.23,16.26 21.93,15.96 CARD1.7 21.93,12.63 v1(21.62,12.32)
PA_26: length 23
  Top Layer w0.104: U1.20 v1(13.02,12.83)
  SIG3 w0.104: 13.46,3.84 13.46,5.09 13.11,5.43 v1(6.53,5.43)
  Bottom Layer w0.104: 5.03,6.18 5.03,6.16 5.77,5.43 v1(6.53,5.43) 7.08,5.43 7.81,6.16 U4.3 ; v1(13.02,12.83) 13.02,10.99 13.46,10.54 v1(13.46,3.81)
PA_27_SD_DET: length 19.7
  Top Layer w0.104: v1(13.84,21.34) 13.46,20.96 13.46,16.26 14.12,15.6 U1.21
  Bottom Layer w0.104: v1(13.84,21.34) 17.02,21.34 17.4,21.72 21.21,21.72 21.88,21.04 24.04,21.04 24.57,20.52 R25.1
PA_27_SD_DET_1: length 15
  Top Layer w0.104: v1(22.27,12.32) 22.27,8.98 22.89,8.35 CN3.23
  Bottom Layer w0.104: 24.52,17.01 D9.2 ; 24.52,17.01 24,17.53 24,18.57 24.57,19.13 ; 24.52,17.01 24.13,16.62 CARD1.9 24.13,12.83 23.62,12.32 v1(22.27,12.32)
PA_28_SPI1_CLK: length 14.4
  Top Layer w0.104: U1.22 15.22,15.52 14.22,16.51 14.22,20.32 v1(14.61,20.7)
  Bottom Layer w0.104: R23.1 20.5,20.9 20.24,21.16 18.17,21.16 17.81,20.81 14.71,20.81 v1(14.61,20.7)
PA_28_SPI1_CLK_1: length 14
  Top Layer w0.104: CN3.21 21.34,6.92 21.34,8 20.96,8.38 20.96,12.13 v1(20.77,12.32)
  Bottom Layer w0.104: v1(20.77,12.32) 19.73,13.35 CARD1.5 ; 19.83,15.07 19.83,16.41 20.07,16.64 20.18,16.64 D11.2 20.96,17.41 20.96,18.7 20.52,19.13 20.5,19.13
PA_29_SPI1_CS: length 6.6
  Top Layer w0.104: v1(17.1,18.59) 16.64,18.12 16.64,16.38 16.32,16.06 U1.23
  Bottom Layer w0.104: v1(17.1,18.59) 17.1,19.34 16.46,19.98 R21.1
PA_29_SPI1_CS_1: length 15.8
  Top Layer w0.104: CN3.19 20.35,8.22 19.94,8.64 19.05,8.64 18.42,9.27 v1(18.42,12.32)
  Bottom Layer w0.104: v1(18.42,12.32) 17.4,12.32 16.43,13.29 CARD1.2 D13.2 15.75,17.62 15.75,18.42 16.43,19.1 16.43,19.13
PA_30: length 31.7
  Top Layer w0.104: U1.24 17.42,15.89 17.65,16.13 17.65,19.09 13.84,22.9 13.84,27.69 v1(13.46,28.07)
  SIG3 w0.104: v1(13.46,28.07) 13.08,27.68 12.44,27.68 11,26.24 3.38,26.24 0.76,23.62 v1(0.76,23.24)
  Bottom Layer w0.104: v1(0.76,23.24) 1.14,23.62 R54.1
PA_30_1: length 37.8
  Top Layer w0.104: v1(13.46,29.59) 14.73,28.32 14.73,23.5 18.42,19.81 18.42,16.26 19.08,15.59 CN3.18
  SIG3 w0.104: v1(13.46,29.59) 13.97,29.08 13.97,27.94 13.46,27.43 12.7,27.43 11,25.73 v1(3.63,25.73)
  Bottom Layer w0.104: U15.3 v1(3.63,25.73) 3.3,25.4 3.07,25.4 R41.2 R54.2
PA_31: length 36.3
  Top Layer w0.104: U13.4 v1(5.8,34.93) ; v1(13.46,28.83) 13.84,28.83 14.43,28.24 14.43,23.29 18.16,19.56 18.16,15.88 18.52,15.52 U1.25
  Bottom Layer w0.104: v1(5.8,34.93) 6.6,34.93 6.82,34.71 R57.1 7.49,34.16 7.87,34.54 8.38,34.54 9.02,33.91 15.24,33.91 16.38,32.77 16.38,29.97 15.24,28.83 v1(13.46,28.83)
PA_32: length 23.5
  Top Layer w0.104: v1(14.61,18.16) 14.61,16.64 15.75,15.49 15.75,13.05 15.97,12.83 16.74,12.83 17.21,12.35 17.21,9.33 17.62,8.93 18.25,8.93 19.08,8.1 CN3.17 19.08,3.97 18.54,3.43 R33.1 ; v1(10.8,18.14) 9.64,18.14 9.39,17.89
  Bottom Layer w0.104: v1(10.8,18.14) 14.59,18.14 v1(14.61,18.16)
PA_33_TP_SDA: length 44
  Top Layer w0.104: 9.39,18.99 10.61,18.99 10.9,19.28 10.9,20.43 12.15,21.68 12.15,25.74 12.7,26.29 12.7,27.28 12.32,27.66 12.32,29.11 13.43,30.23 19.81,30.23 21.08,28.96 v1(23.37,28.96)
  Bottom Layer w0.104: FPC1.19 32.12,27.06 31.88,27.31 28.58,27.31 27.47,28.41 D7.2 27.47,32.09 ; R47.1 27.47,32.11 26.82,32.77 26.16,32.77 25.9,33.03 24.84,33.03 24.09,33.78 23.21,33.78 22.78,33.35 22.78,29.54 v1(23.37,28.96)
PA_34_KEY1: length 45.3
  Top Layer w0.104: v1(31.12,28.7) 30.32,28.7 R34.2 30.28,29.97 30.27,29.97 32.26,29.97 32.74,29.49 SW1.2 ; v1(23.75,2.41) 23.52,2.64 23.52,4.63 24.04,5.16 24.61,5.16 24.77,5.31 24.77,8.26 24.16,8.86 CN3.26 24.16,12.64 24.57,13.04 24.57,15.23 24.26,15.54 24.26,20.96 24.51,21.21 24.51,22.61 24.26,22.86 24.26,25.14 23.87,25.52 23.87,26.8 24.51,27.43 24.51,28.96 24.99,29.44 27.71,29.44 v1(28.07,29.08) ; TP8.1 21.58,2.41 v1(22.73,2.41)
  SIG3 w0.104: v1(31.12,28.7) 28.45,28.7 v1(28.07,29.08)
  Bottom Layer w0.104: v1(22.73,2.41) v1(23.75,2.41)
PA_34_PWRKEY: length 41.7
  Top Layer w0.104: 9.39,20.09 10.44,20.09 10.58,20.23 10.58,20.86 11.94,22.23 11.94,25.91 12.45,26.42 12.45,27.21 12.05,27.6 12.05,29.23 13.43,30.61 19.97,30.61 v1(20.97,29.61) ; R35.2 29.43,27.61 R34.1 29.09,29.08 v1(28.96,29.08)
  SIG3 w0.104: v1(25.15,34.31) 25.51,34.31 27.56,32.26 27.56,29.72 27.81,29.46 28.23,29.46 28.61,29.08 v1(28.96,29.08)
  Bottom Layer w0.104: v1(20.97,29.61) 21.37,29.21 22.1,29.21 22.48,29.59 22.48,33.78 23.37,34.67 24.79,34.67 v1(25.15,34.31) 26.79,34.31 27.07,34.02 Q1.1
PA_35_USB_DP: length 23.7
  Top Layer w0.104: CN3.15 17.81,7.97 17.55,8.23 16.79,8.23 16.51,8.51 14.95,8.51 14.61,8.85 14.61,12.19 14.35,12.45 13.97,12.45 13.59,12.83 13.59,15.37 13.21,15.75 13.21,21.34 13.59,21.72 13.59,22.23 12.7,23.12 12.7,25.14 v1(13.08,25.53)
  Bottom Layer w0.104: R56.1 13.08,24.98 v1(13.08,25.53)
PA_36_USB_DM: length 24.3
  Top Layer w0.104: CN3.13 16.54,8 16.32,8.22 14.13,8.22 13.34,9.02 13.34,11.94 12.45,12.83 12.45,25.65 13.08,26.29 v1(13.08,26.92)
  Bottom Layer w0.104: v1(13.08,26.92) 13.08,26.25 R55.1
PA_37_TP_SCL: length 41
  Top Layer w0.104: 9.39,23.39 9.62,23.62 10.41,23.62 10.92,24.13 10.92,25.43 12.07,26.58 12.07,27.18 11.77,27.47 11.77,29.25 13.52,30.99 20.41,30.99 21.81,29.59 v1(21.84,29.59)
  Bottom Layer w0.104: FPC1.20 30.22,27.56 29.46,28.32 D6.2 29.49,30.94 30.1,31.55 30.1,33.01 29.51,33.6 R48.1 29.51,33.65 28.87,34.29 28.57,34.29 27.93,34.93 23.24,34.93 22.23,33.91 22.23,30.01 21.81,29.59
PA_38: length 20.9
  Top Layer w0.104: v1(8,13.72) 7.87,13.72 7.62,13.46 7.62,12.66 v1(6.57,11.61) ; 9.39,24.49 8.82,24.49 8.26,23.93 8.26,22.76 v1(7.35,21.86)
  SIG3 w0.104: v1(10.8,16.51) 9.19,18.12 9.19,21.68 8.64,22.23 7.72,22.23 v1(7.35,21.86)
  Bottom Layer w0.104: v1(10.8,16.51) 9.4,16.51 8.94,16.05 8.94,14.65 v1(8,13.72) ; U2.B2 6.91,11.27 v1(6.57,11.61) R3.2
PA_39_I2C1_SDA: length 81.7
  Top Layer w0.104: U13.14 7.92,33.32 v1(8.13,33.53) ; v1(23.37,29.63) 21.63,31.37 v1(15.88,31.37) 13.34,31.37 v1(11.94,29.97) 11.94,29.76 11,28.82 11,27.61 11.43,27.18 11.43,26.67 10.35,25.59 9.39,25.59 ; CN3.14 16.54,12.37 16.33,12.58 15.11,12.58 14.61,13.09 14.61,15.49 13.84,16.26 13.84,20.57 14.35,21.08 14.35,21.84 13.59,22.61 13.59,27.18 v1(12.7,28.07) ; v1(23.37,33.27) 23.92,33.83 27.64,33.83 28.07,33.4 28.93,33.4 29.39,32.94 29.42,32.94 30.03,33.54 30.03,34.6 31.55,36.12
  SIG3 w0.104: v1(1.27,26.54) 3.43,28.7 9.02,28.7 11.56,31.24 12.19,31.24 12.49,30.94 12.49,30.53 v1(11.94,29.97)
  Bottom Layer w0.104: 1.26,25.54 1.26,26.53 v1(1.27,26.54) ; v1(8.13,33.53) 14.99,33.53 15.88,32.64 v1(15.88,31.37) ; v1(23.37,33.27) 22.99,32.89 22.99,30.02 v1(23.37,29.63) ; v1(11.94,29.97) 12.32,29.59 12.32,28.45 v1(12.7,28.07)
PA_40_I2C1_SCL: length 74.6
  Top Layer w0.104: U13.13 8.09,32.82 v1(8.13,32.86) ; v1(24.77,30.35) 24.89,30.48 29.73,30.48 30.27,31.02 R45.1 30.27,34.44 31.95,36.12 ; v1(12.7,28.83) 13.08,28.45 13.72,28.45 14.1,28.07 14.1,23.11 17.91,19.3 17.91,15.62 18,15.53 18,12.79 17.81,12.6 CN3.16 ; 9.39,26.69 9.39,26.7 9.56,26.87 10.41,26.87 10.8,27.25 10.8,28.92 11.53,29.65 11.53,30.22 11.93,30.61 v1(11.94,30.61) 13.08,31.75 v1(15.24,31.75) 21.97,31.75 v1(23.37,30.35)
  SIG3 w0.104: v1(2.92,26.54) 3.56,27.18 7.75,27.18 8.14,27.57 8.9,27.57 v1(11.94,30.61)
  Bottom Layer w0.104: v1(8.13,32.86) 8.41,33.15 14.73,33.15 15.24,32.64 v1(15.24,31.75) ; v1(11.94,30.61) 12.7,29.85 v1(12.7,28.83) ; v1(2.92,26.54) 2.56,26.18 2.56,25.54 ; v1(23.37,30.35) v1(24.77,30.35)
PA_41_TP_INT: length 32.8
  Top Layer w0.104: v1(23.37,30.99) 22.23,32.13 12.83,32.13 11.3,30.61 11.3,29.81 10.59,29.1 10.59,27.91 10.47,27.79 9.39,27.79
  Bottom Layer w0.104: FPC1.18 32.11,26.56 31.62,27.05 27.56,27.05 26.27,28.34 D8.2 R46.1 26.27,32.09 25.72,32.64 23.75,32.64 23.37,32.26 v1(23.37,30.99)
PA_42: length 39.9
  Top Layer w0.104: v1(24.89,16.26) 24.89,20.88 25.4,21.39 25.4,23.91 25.15,24.17 v1(25.15,28.32) ; 9.39,31.09 10.51,31.09 12.83,33.4 21.59,33.4 23.88,31.12 23.88,28.58 v1(23.37,28.07)
  Bottom Layer w0.104: v1(23.37,28.07) 24.89,28.07 v1(25.15,28.32) ; U6.1 27.22,13.63 R29.2 26.59,13.8 26.42,13.97 26.42,15.62 25.78,16.26 v1(24.89,16.26)
PA_43: length 35.4
  Top Layer w0.104: 9.39,32.19 11.11,32.19 12.57,33.66 21.94,33.66 23.84,31.75 23.88,31.75 24.22,31.41 24.22,28.16 23.57,27.51 v1(23.57,21.42) ; R32.2 29.43,16.94 R31.1 v1(29.43,18.67)
  SIG3 w0.104: v1(23.57,21.42) 23.59,21.42 24.19,20.83 27.27,20.83 v1(29.43,18.67)
PA_43_KEY2: length 22.5
  Top Layer w0.104: v1(30.99,17.65) 30.71,17.65 R31.2 30.27,18.09 30.27,19.31 30.32,19.35 SW2.2 ; CN3.28 25.43,11.97 v1(26.04,12.57)
  SIG3 w0.104: v1(30.99,17.65) 29.21,17.65 26.8,20.07 24.77,20.07 24.26,19.56 24.26,16.32 26.04,14.54 v1(26.04,12.57)
PA_44_VBUSDET: length 28.4
  Top Layer w0.104: 9.39,33.29 10.51,33.29 v1(11.03,32.76) ; v1(7.37,22.67) 7.37,22.86 8.05,23.54 8.05,24.18 8.33,24.46 8.33,24.87 8.48,25.02 10.22,25.02 11.68,26.49 11.68,27.23 11.39,27.52 v1(11.39,28.06)
  SIG3 w0.104: v1(10.8,17.53) 9.56,18.76 9.56,21.94 8.83,22.67 v1(7.37,22.67) ; v1(11.39,28.06) 11.39,28.88 12.95,30.45 12.95,30.84 v1(11.03,32.76)
  Bottom Layer w0.104: R15.2 7.41,16.16 7.41,17.25 ; v1(10.8,17.53) 7.67,17.53 R14.1
SPK_GND: length 44.1
  Top Layer w0.508: 29.8,6.48 30.18,6.86 ; 29.8,6.48 29.8,6.86 ; 29.8,6.48 29.43,6.86 ; 30.18,6.86 29.8,6.86 ; 30.18,6.86 v1(30.73,6.86) 32.54,6.86 CN2.4 ; 28.19,7.18 28.19,14.09 v1(27.63,14.65) ; 28.19,7.18 28.52,6.86 ; 28.19,7.18 28.19,6.87 ; 29.8,6.86 29.43,6.86 ; 28.52,6.86 29.43,6.86 ; 28.52,6.86 28.19,6.54 28.19,6.87 ; 28.52,6.86 28.2,6.86 28.19,6.87
  Top Layer w0.635: CN2.4 32.38,6.55 31.8,5.97 31.8,5.13
  Top Layer w0.762: 32.84,7.34 CN2.4 ; 32.84,7.34 32.26,7.92 v1(32.26,11.38) ; 32.84,7.34 32.87,7.18 33.41,6.64 ; 32.77,11.63 32.52,11.38 v1(32.26,11.38) ; 32.77,11.63 33.58,11.63 ; 32.77,11.63 32.51,11.63 v1(32.26,11.38) ; 32.77,11.63 CN2.3 ; 31.99,11.59 32.06,11.59 v1(32.26,11.38) ; 32.7,7.25 32.19,6.74 32.19,6.67 ; 32.88,6.52 32.88,4.43
  Bottom Layer w0.203: U6.7 27.87,7.11 arc(27.94,6.75) 28.14,6.46 28.4,6.19 arc(28.87,5.88) 29.41,5.78 30.18,5.78 arc(30.48,5.72) 30.74,5.55 arc(30.92,5.42) 31.14,5.38 32.12,5.38 C18.2
  Bottom Layer w0.381: C24.1 v1(27.63,14.65) R29.1 ; v1(28,9.02) 27.87,8.89 U6.7 ; C18.2 32.96,7 C25.2 D2.1 30.73,7.45 v1(30.73,6.86) ; v1(32.26,11.38) 32.26,10.84 C22.1 D1.1
SPK_OUTN: length 8.9
  Top Layer w0.381: 29.86,9.75 30.15,10.04 v1(30.15,10.41) 29.64,9.91 CN2.1 29.86,9.75
  Bottom Layer w0.381: v1(30.15,10.41) 30.58,9.99 D1.2 32.26,9.99 ; 33.62,8.6 34.22,9.2 34.22,10.73 34.04,10.91 33.6,10.91 ; L1.2 32.97,10.4 32.97,10.36 32.6,9.99 C22.2
SPK_OUTP: length 8.3
  Top Layer w0.381: CN2.2 30.73,8.5 30.71,8.53 v1(30.55,8.53)
  Bottom Layer w0.381: L2.2 32.84,4.7 33.91,5.77 33.91,7.32 C23.1 33.32,7.7 32.47,8.55 30.99,8.55 ; v1(30.55,8.53) 30.96,8.53 D2.2
UART_RXD: length 32.6
  Top Layer w0.104: v1(25.02,23.62) 25.02,21.37 24.51,20.86 24.51,15.88 25.78,14.61 25.78,13.08 24.81,12.11 24.81,8.98 25.43,8.35 CN3.27 25.43,5.33 24.94,4.84 24.17,4.84 23.75,4.41 23.75,2.99 24.2,2.54 24.77,2.54 25.65,1.65 TP5.1
  Bottom Layer w0.104: v1(25.02,23.62) 24.77,23.62 24.51,23.87 24.51,24.89 23.95,25.45 22.77,25.45 22.63,25.32 R12.1 20.53,24.93
UART_TXD: length 26
  Top Layer w0.104: TP4.1 23.29,1.56 23.29,4.88 24.16,5.75 CN3.25 24.16,8.35 23.57,8.95 23.57,12.49 23.46,12.6 23.46,20.61 23.17,20.9 23.17,22.57 v1(22.63,23.11)
  Bottom Layer w0.104: v1(22.63,23.11) R11.1 20.53,23.66
USB_VBUS_5V: length 19.9
  Top Layer w0.104: USB1.B9 6.07,20.25 5.53,19.71 5.15,19.71 ; USB1.B4 6.08,15.75 5.62,16.21 ; v1(4.83,20.45) 4.94,20.33 5.65,20.33 5.87,20.55 USB1.A4 ; 6.3,15.48 5.8,15.48 5.58,15.71 5.15,15.71
  Top Layer w0.635: CN3.2 8.92,14.04 7.97,14.98 7.97,15.3 7.67,15.61 6.53,15.61 ; 8.89,10.64 8.89,5.21 TP2.1
  vias: v1(3.68,20.45) v1(4.25,20.45)
VSYS: length 44
  Top Layer w0.457: R26.1 24.35,3.6 v1(24.35,4.37)
  Top Layer w0.635: v1(12.73,8.38) v1(12.73,9.02) CN3.8
  SIG3 w0.457: 13.06,8.06 v1(12.73,8.38) 12.4,8.06 ; 13.06,8.06 13.62,7.49 15.24,7.49 16.38,6.35 22.37,6.35 v1(24.35,4.37) ; 13.06,8.06 12.4,8.06 ; 12.4,8.06 11.71,7.36 5.58,7.36 3.81,5.59 v1(2.41,5.59)
  SIG3 w0.508: v1(12.73,8.38) v1(12.73,9.02)
  Bottom Layer w0.254: 2.71,6.17 3.01,6.17 3.02,6.19 ; 2.71,6.17 2.47,6.17 ; 2.71,6.17 2.71,5.93 ; 2.47,6.17 2.47,5.77 ; 2.47,6.17 U19.A2 ; 2.47,6.17 2.71,5.93 ; 2.71,5.93 2.71,5.8 2.92,5.59 ; 2.71,5.93 3.02,5.61
  Bottom Layer w0.305: U2.A2 7.62,11.3
  Bottom Layer w0.381: 8.17,11.86 8.11,11.92 8.11,12.26 8.17,12.32 ; 8.17,11.86 8.53,12.21 ; 8.17,11.86 7.62,11.3 ; 8.73,12.21 C4.2
  Bottom Layer w0.457: 8.17,12.32 8.69,12.32 C4.2 ; 2.71,5.93 2.62,5.93 2.47,5.77 2.47,5.64 v1(2.41,5.59) 2.92,5.59 R59.2 3.02,6.79 R58.2
  Bottom Layer w0.635: v1(12.73,8.38) v1(12.73,9.02) 12.73,9.05 11.94,9.84 10.99,9.84 10.54,10.29 10.54,11.27 9.57,12.24 C4.2
VSYS_1: length 51.7
  Top Layer w0.457: R49.2 4.95,30.94 v1(4.95,30.99)
  SIG3 w0.457: 12.7,17.65 12.32,17.27 ; 12.7,17.65 12.32,17.65 ; 12.7,17.65 15.24,20.19 15.24,29.97 11.81,33.4 10.29,33.4 9.4,32.51 9.4,30.73 8.89,30.23 5.72,30.23 v1(4.95,30.99) ; 12.32,17.27 12.32,17.65 ; 12.32,17.27 12.32,14.83 8,10.51 v1(8,10.03) ; v1(6.86,23.37) 9.31,23.37 10.05,22.63 10.05,19.92 12.32,17.65
  Bottom Layer w0.254: U2.A1 7.42,10.49 ; 7.42,10.49 7.42,10.08 ; 7.42,10.49 7.62,10.29
  Bottom Layer w0.381: C9.2 7.42,10.08 7.62,10.29
  Bottom Layer w0.457: C33.2 6.23,23.99 v1(6.86,23.37)
VSYS_S: length 59.6
  Top Layer w0.762: CN3.7 v1(12.73,4.45) v1(12.73,3.81)
  SIG3 w0.508: v1(1.02,9.91) v1(1.02,9.4) 1.54,8.87 8.55,8.87 10.6,10.92 16,10.92 18.29,13.21 18.29,15.62 19.95,17.27 21.08,17.27 23.88,14.48 23.88,11.56 21.72,9.4 v1(21.72,8.93) v1(21.72,8.38)
  SIG3 w0.762: v1(12.73,3.81) v1(12.73,4.45)
  Bottom Layer w0.104: 1.35,9.62 1.06,9.91 v1(1.02,9.91) 1.3,9.62
  Bottom Layer w0.254: U3.A2 2.11,11.36 1.7,11.36
  Bottom Layer w0.508: 1.7,11.36 1.52,11.18 1.52,10.29 ; 1.52,10.29 1.52,9.84 C6.2 1.59,9.4 v1(1.02,9.4) v1(1.02,9.91) 1.4,10.29 1.52,10.29 ; v1(12.73,4.45) v1(12.73,3.81) 12.73,3.28 13.1,2.9 16.36,2.9 18.8,5.33 20.7,5.33 21.72,6.35 v1(21.72,8.38) v1(21.72,8.93)
$2N93902: length 40.1
  Top Layer w0.381: v1(21.08,16.26) 20.72,15.89 U1.27
  SIG3 w0.457: v1(4.06,3.05) 1.65,5.46 1.65,6.02 2.11,6.48 3.81,6.48 5.26,7.92 9.07,7.92 11.05,9.91 20.96,9.91 22.99,11.94 22.99,14.35 v1(21.08,16.26)
  Bottom Layer w0.254: 21.85,19.13 21.83,19.13 21.28,18.59 21.28,17.46 21.74,17 21.83,17
  Bottom Layer w0.381: C1.2 21.83,17 v1(21.08,16.26) ; v1(4.06,3.05) 3.58,3.53 R1.1
